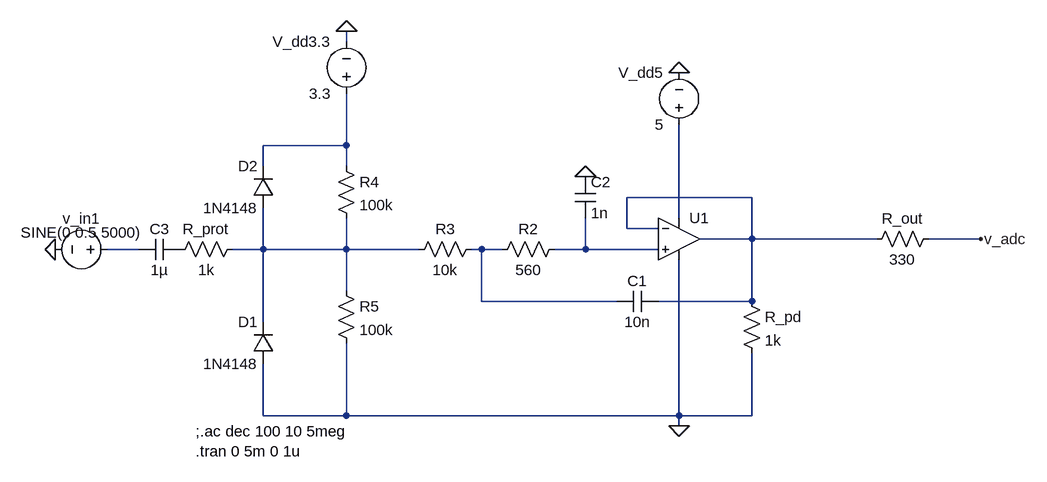
[diagram p0: schematic ECE 362 - Single Anti-aliasing filter and Input Protection System for ADC.asc]
ECE 362 - Single Anti-aliasing filter and Input Protection System for ADC.asc, the LTspice schematic file:
Version 4
SHEET 1 1120 680
WIRE 64 16 64 0
WIRE 64 176 64 96
WIRE 64 176 -64 176
WIRE -64 208 -64 176
WIRE 64 208 64 176
WIRE 688 256 496 256
WIRE 576 288 576 144
WIRE 496 304 496 256
WIRE 544 304 496 304
WIRE 688 320 688 256
WIRE 688 320 608 320
WIRE 880 320 688 320
WIRE 1040 320 960 320
WIRE -256 336 -304 336
WIRE -64 336 -64 272
WIRE -64 336 -112 336
WIRE 64 336 64 288
WIRE 64 336 -64 336
WIRE 176 336 64 336
WIRE 272 336 256 336
WIRE 304 336 272 336
WIRE 432 336 432 288
WIRE 432 336 384 336
WIRE 544 336 432 336
WIRE 64 400 64 336
WIRE 272 416 272 336
WIRE 480 416 272 416
WIRE 688 416 688 320
WIRE 688 416 544 416
WIRE -64 448 -64 336
WIRE -64 592 -64 512
WIRE 64 592 64 480
WIRE 64 592 -64 592
WIRE 576 592 576 352
WIRE 576 592 64 592
WIRE 688 592 688 496
WIRE 688 592 576 592
WIRE 576 608 576 592
FLAG 576 608 0
FLAG 576 64 0
FLAG 432 224 0
FLAG -384 336 0
FLAG 1040 320 v_adc
FLAG 64 0 0
SYMBOL Voltage 576 160 R180
WINDOW 0 24 96 Left 2
WINDOW 3 24 16 Left 2
SYMATTR InstName V_dd5
SYMATTR Value 5
SYMBOL Cap 544 400 R90
WINDOW 0 0 32 VBottom 2
WINDOW 3 32 32 VTop 2
SYMATTR InstName C1
SYMATTR Value 10n
SYMBOL Res 400 320 R90
WINDOW 0 0 56 VBottom 2
WINDOW 3 32 56 VTop 2
SYMATTR InstName R2
SYMATTR Value 560
SYMBOL Res 272 320 R90
WINDOW 0 0 56 VBottom 2
WINDOW 3 32 56 VTop 2
SYMATTR InstName R3
SYMATTR Value 10k
SYMBOL Cap 416 224 R0
SYMATTR InstName C2
SYMATTR Value 1n
SYMBOL Voltage -288 336 R90
WINDOW 0 -32 56 VBottom 2
WINDOW 3 -10 56 VBottom 2
SYMATTR InstName v_in1
SYMATTR Value SINE(0 0.5 5000)
SYMATTR Value2 AC 100m
SYMBOL OpAmps/UniversalOpAmp2 576 320 R0
SYMATTR InstName U1
SYMBOL Res 48 192 R0
SYMATTR InstName R4
SYMATTR Value 100k
SYMBOL Res 48 384 R0
SYMATTR InstName R5
SYMATTR Value 100k
SYMBOL Cap -256 352 R270
WINDOW 0 32 32 VTop 2
WINDOW 3 0 32 VBottom 2
SYMATTR InstName C3
SYMATTR Value 1µ
SYMBOL Res 976 304 R90
WINDOW 0 0 56 VBottom 2
WINDOW 3 32 56 VTop 2
SYMATTR InstName R_out
SYMATTR Value 330
SYMBOL Voltage 64 112 R180
WINDOW 0 24 96 Left 2
WINDOW 3 24 16 Left 2
SYMATTR InstName V_dd3.3
SYMATTR Value 3.3
SYMBOL Diode -48 512 R180
WINDOW 0 24 64 Left 2
WINDOW 3 24 0 Left 2
SYMATTR InstName D1
SYMATTR Value 1N4148
SYMBOL Diode -48 272 R180
WINDOW 0 24 64 Left 2
WINDOW 3 24 0 Left 2
SYMATTR InstName D2
SYMATTR Value 1N4148
SYMBOL Res -96 320 R90
WINDOW 0 0 56 VBottom 2
WINDOW 3 32 56 VTop 2
SYMATTR InstName R_prot
SYMATTR Value 1k
SYMBOL Res 672 400 R0
SYMATTR InstName R_pd
SYMATTR Value 1k
TEXT -168 616 Left 2 !;.ac dec 100 10 5meg\n.tran 0 5m 0 1u

The netlist it stands for:
* ECE 362 - Single Anti-aliasing filter and Input Protection System for ADC.asc
V_dd5 N003 0 5
C1 N002 N006 10n
R2 N007 N006 560
R3 N006 N005 10k
C2 0 N007 1n
v_in1 N004 0 SINE(0 0.5 5000) AC 100m
XU1 N007 N002 N003 0 N002 level2 Avol=1Meg GBW=10Meg Slew=10Meg Ilimit=25m Rail=0 Vos=0 En=0 Enk=0 In=0 Ink=0 Rin=500Meg  ; pins In+ In- V+ V- OUT
R4 N001 N005 100k
R5 N005 0 100k
C3 N004 P001 1µ
R_out v_adc N002 330
V_dd3.3 N001 0 3.3
D1 0 N005 1N4148
D2 N005 N001 1N4148
R_prot N005 P001 1k
R_pd N002 0 1k
.model D D
.lib standard.dio
;.ac dec 100 10 5meg
.tran 0 5m 0 1u
.lib UniversalOpAmp2.lib
.backanno
.end